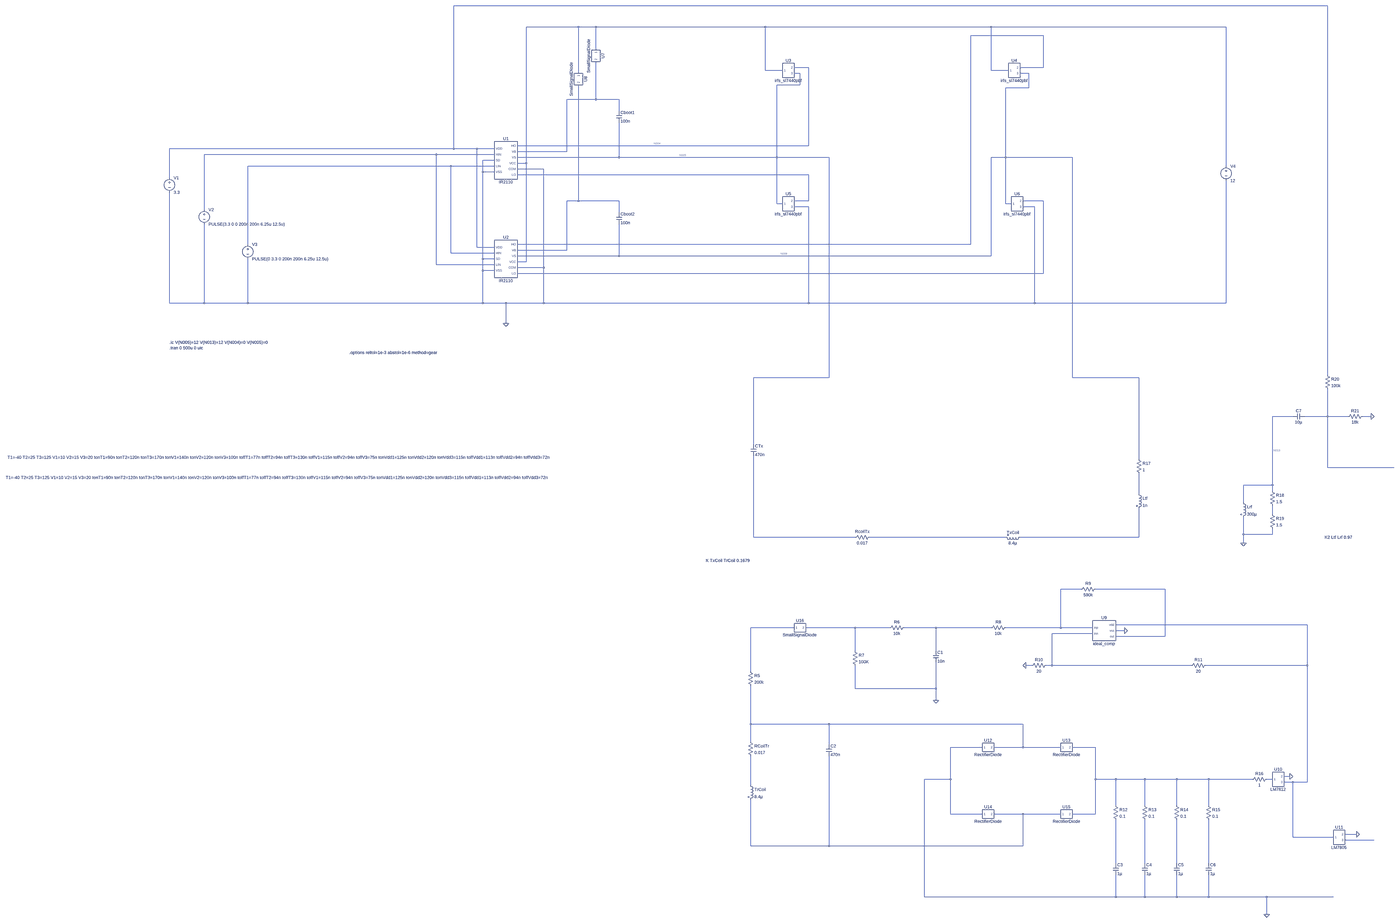
[diagram p0: schematic Integrated Circuit.asc, whole sheet]
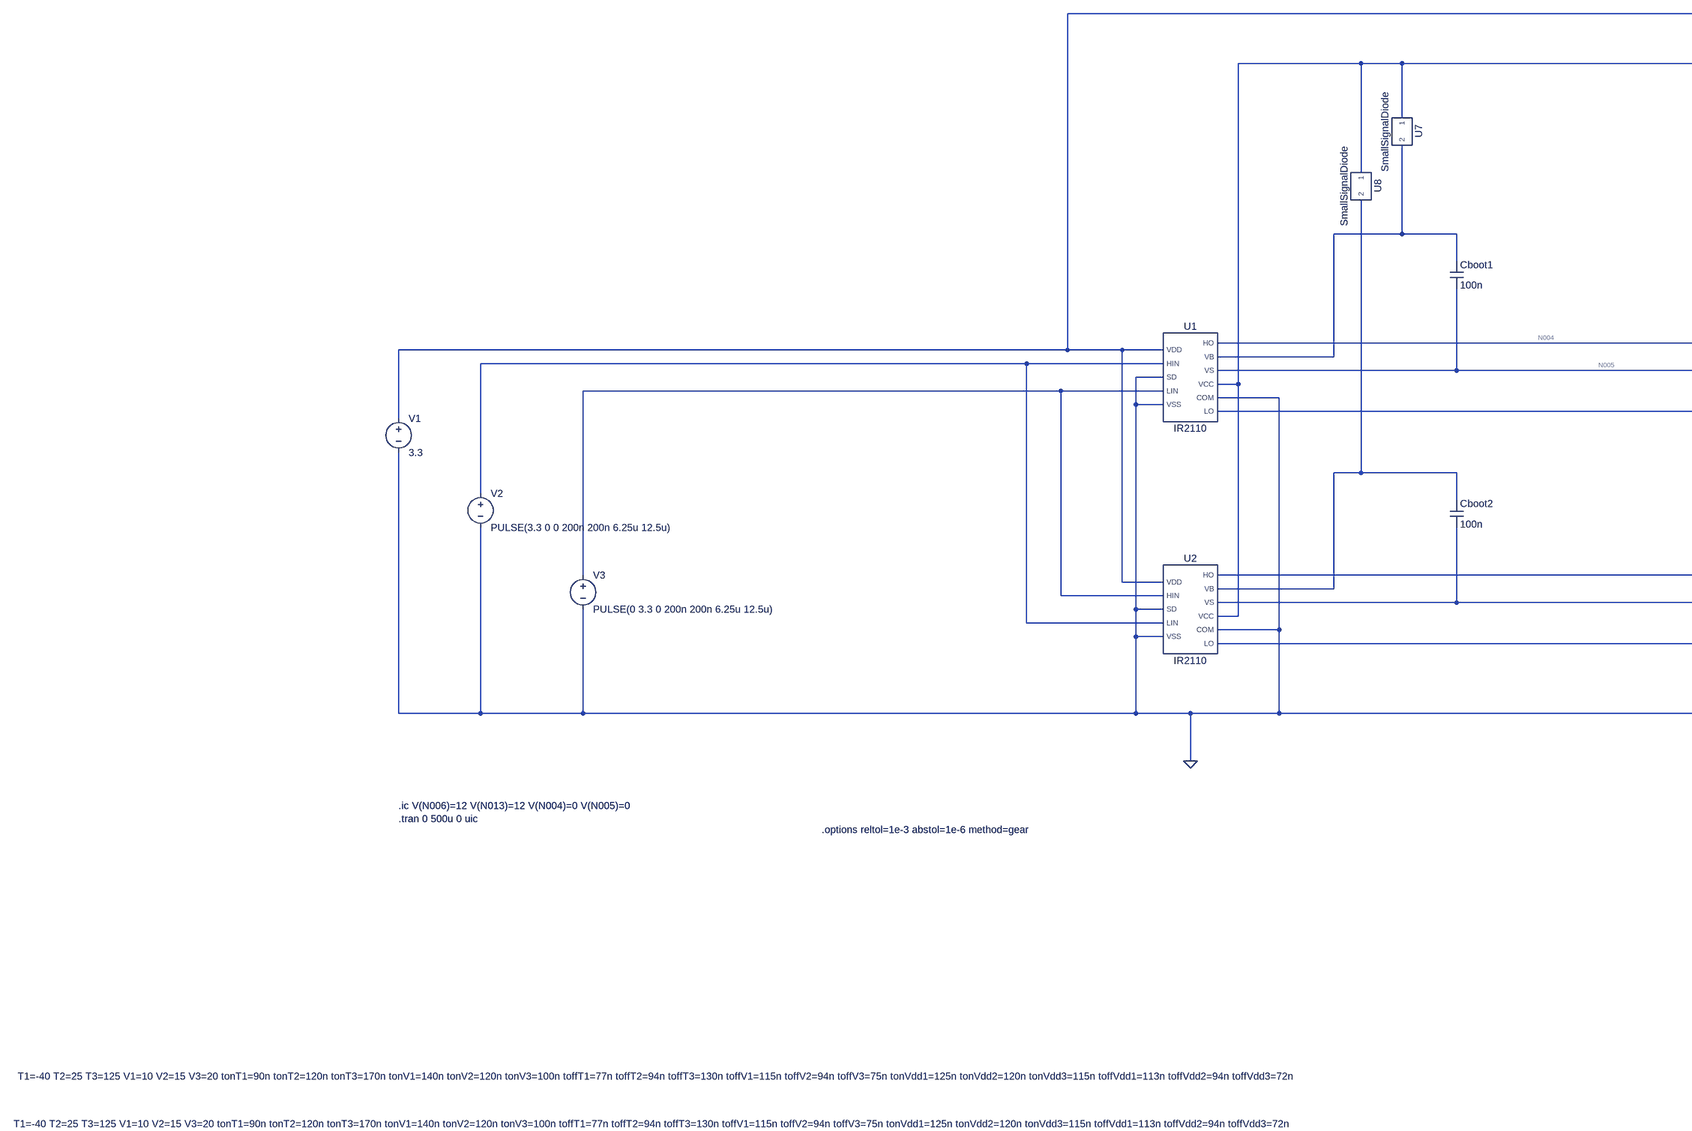
[diagram p1: schematic Integrated Circuit.asc, part, row 1 of 2, column 1 of 2]
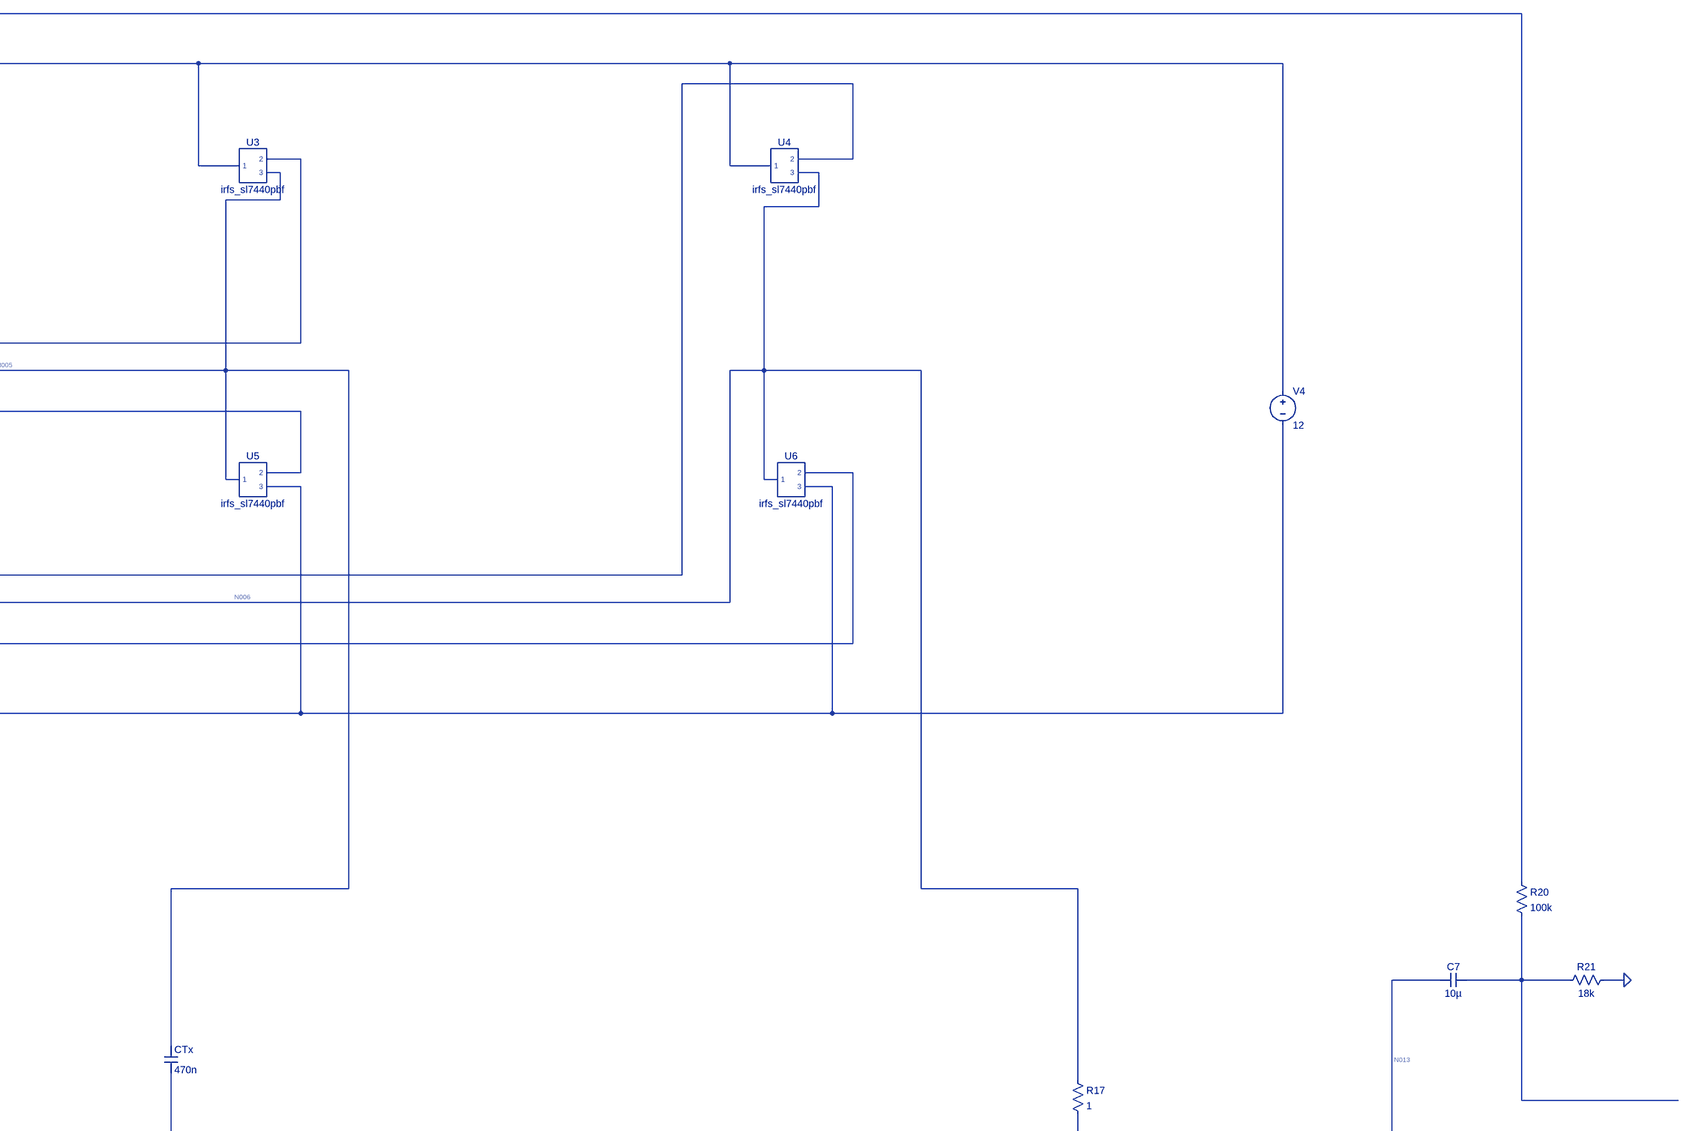
[diagram p2: schematic Integrated Circuit.asc, part, row 1 of 2, column 2 of 2]
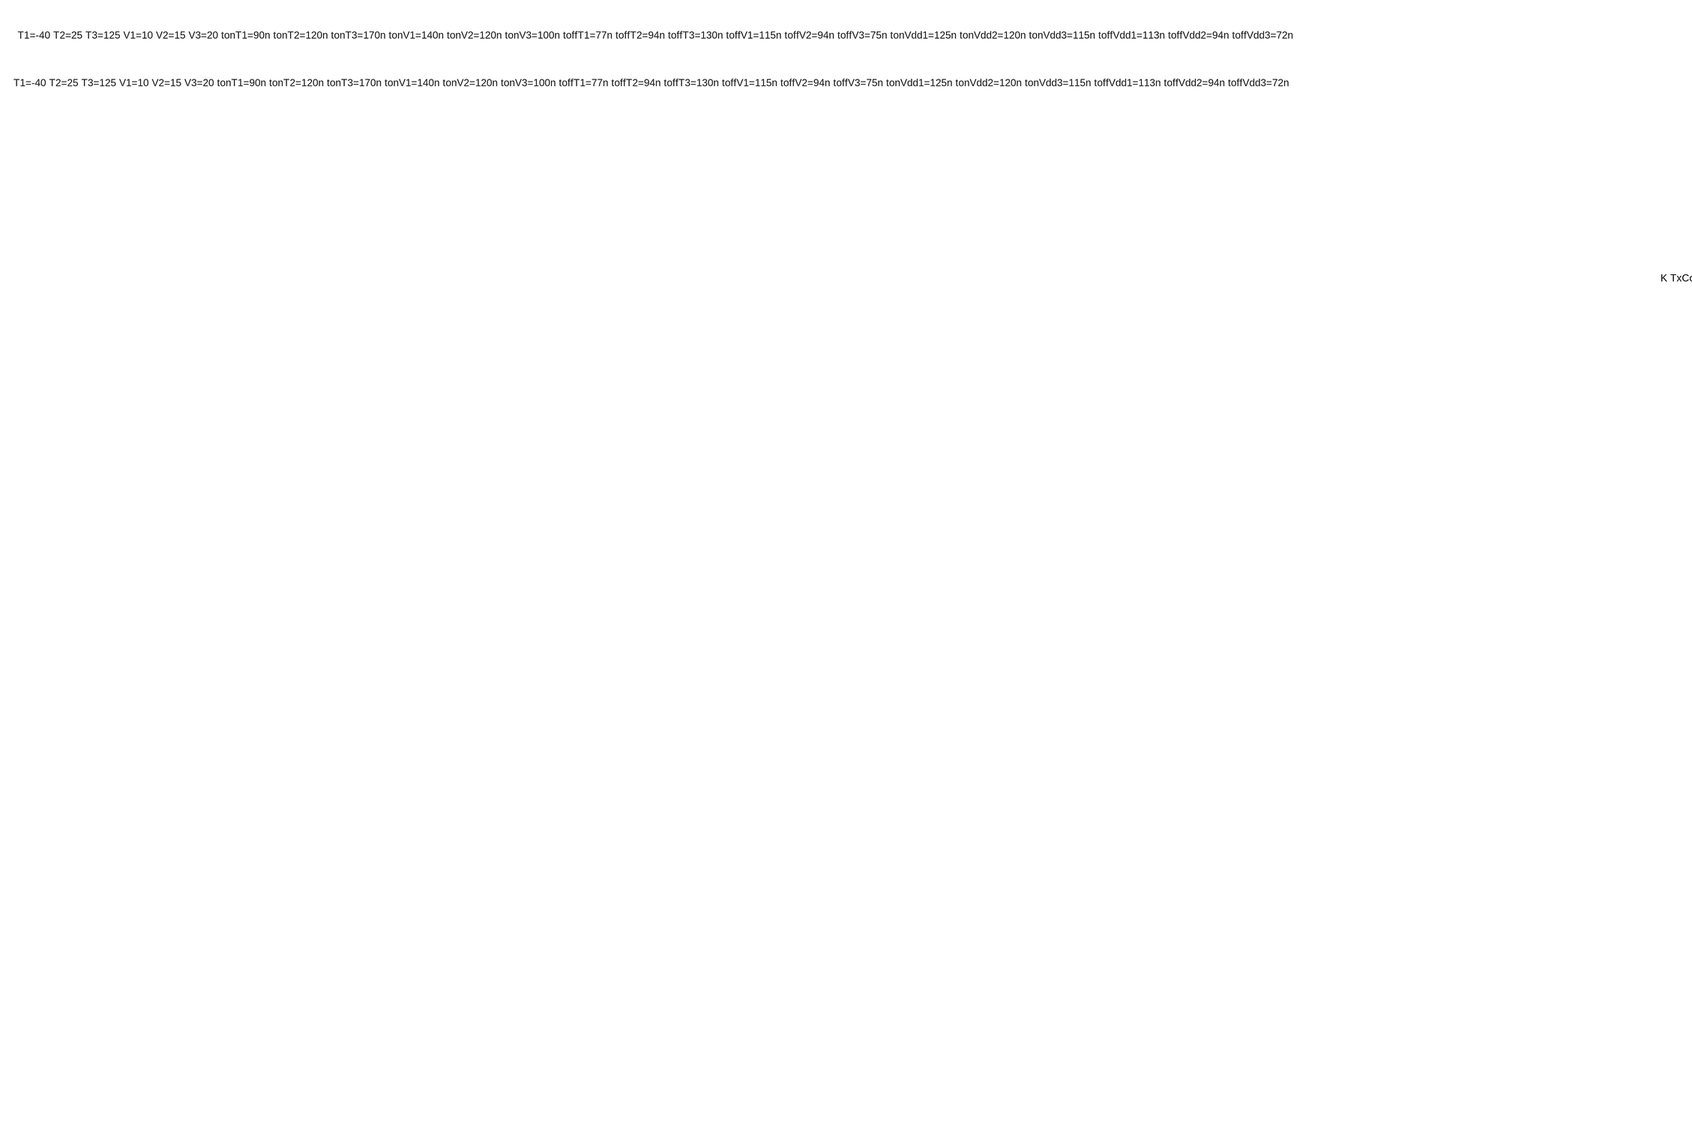
[diagram p3: schematic Integrated Circuit.asc, part, row 2 of 2, column 1 of 2]
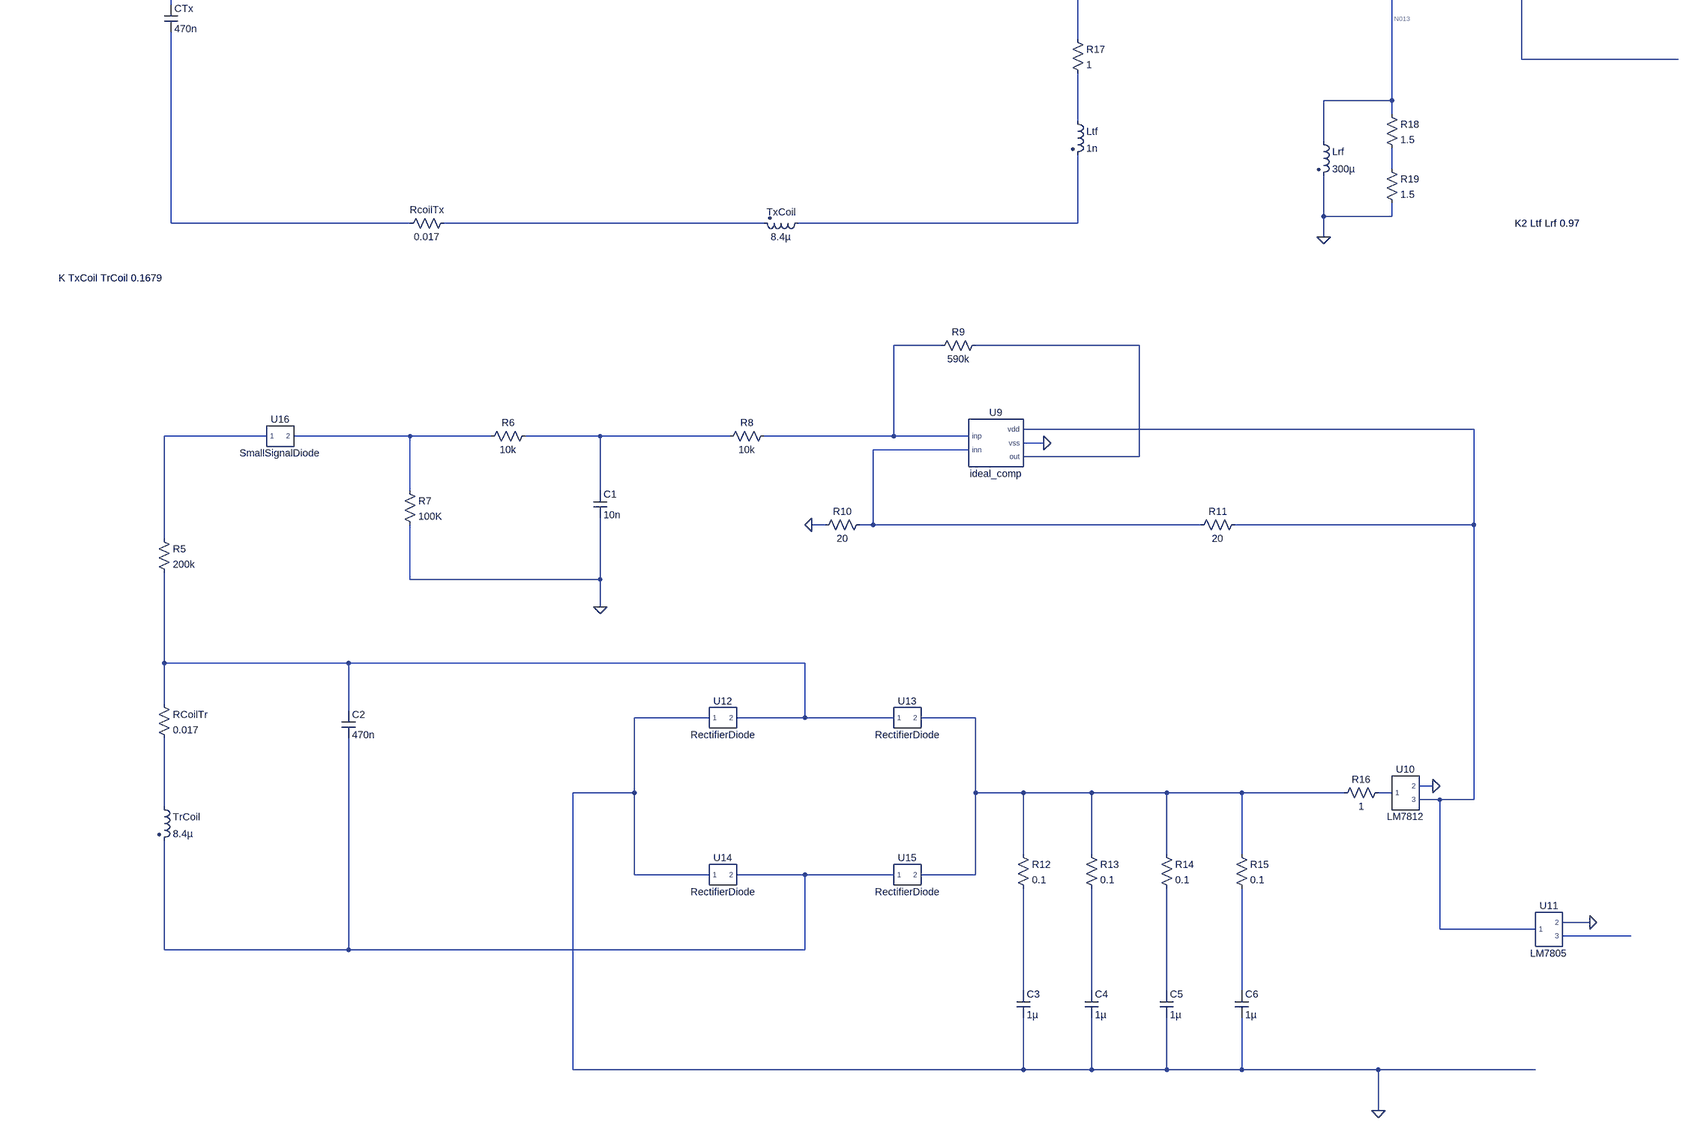
[diagram p4: schematic Integrated Circuit.asc, part, row 2 of 2, column 2 of 2]
Integrated Circuit.asc, the LTspice schematic file:
Version 4.1
SHEET 1 5604 5012
WIRE 5136 -896 -144 -896
WIRE 544 -688 256 -688
WIRE 640 -688 544 -688
WIRE 1920 -688 640 -688
WIRE 3280 -688 1920 -688
WIRE 4576 -688 3280 -688
WIRE 3568 -640 3168 -640
WIRE 640 -560 640 -688
WIRE 2160 -464 2080 -464
WIRE 3568 -464 3568 -640
WIRE 3568 -464 3440 -464
WIRE 1920 -448 1920 -688
WIRE 2016 -448 1920 -448
WIRE 3280 -448 3280 -688
WIRE 3376 -448 3280 -448
WIRE 544 -432 544 -688
WIRE 2112 -432 2080 -432
WIRE 3488 -432 3440 -432
WIRE 2112 -368 2112 -432
WIRE 2112 -368 1984 -368
WIRE 3488 -352 3488 -432
WIRE 3488 -352 3360 -352
WIRE 640 -288 640 -496
WIRE 640 -288 480 -288
WIRE 768 -288 640 -288
WIRE 768 -224 768 -288
WIRE 2160 -32 2160 -464
WIRE 2160 -32 208 -32
WIRE -144 -16 -144 -896
WIRE -144 -16 -1712 -16
WIRE -16 -16 -144 -16
WIRE 80 -16 -16 -16
WIRE 480 0 480 -288
WIRE 480 0 208 0
WIRE -240 16 -1520 16
WIRE 80 16 -240 16
WIRE 768 32 768 -160
WIRE 768 32 208 32
WIRE 1984 32 1984 -368
WIRE 1984 32 768 32
WIRE 2272 32 1984 32
WIRE 3360 32 3360 -352
WIRE 3360 32 3280 32
WIRE 3728 32 3360 32
WIRE 80 48 16 48
WIRE 256 64 256 -688
WIRE 256 64 208 64
WIRE -160 80 -1280 80
WIRE 80 80 -160 80
WIRE 4576 80 4576 -688
WIRE 352 96 208 96
WIRE 16 112 16 48
WIRE 80 112 16 112
WIRE 2160 128 208 128
WIRE -1712 144 -1712 -16
WIRE 544 272 544 -368
WIRE 544 272 480 272
WIRE 768 272 544 272
WIRE 2160 272 2160 128
WIRE 2160 272 2080 272
WIRE 3568 272 3456 272
WIRE 1984 288 1984 32
WIRE 2016 288 1984 288
WIRE 3360 288 3360 32
WIRE 3392 288 3360 288
WIRE 2160 304 2080 304
WIRE 3520 304 3456 304
WIRE -1520 320 -1520 16
WIRE 768 336 768 272
WIRE -1280 512 -1280 80
WIRE 3168 512 3168 -640
WIRE 3168 512 208 512
WIRE -16 528 -16 -16
WIRE 80 528 -16 528
WIRE 480 544 480 272
WIRE 480 544 208 544
WIRE -160 560 -160 80
WIRE 80 560 -160 560
WIRE 768 576 768 400
WIRE 768 576 208 576
WIRE 3280 576 3280 32
WIRE 3280 576 768 576
WIRE 16 592 16 112
WIRE 80 592 16 592
WIRE 256 608 256 64
WIRE 256 608 208 608
WIRE -240 624 -240 16
WIRE 80 624 -240 624
WIRE 352 640 352 96
WIRE 352 640 208 640
WIRE 16 656 16 592
WIRE 80 656 16 656
WIRE 3568 672 3568 272
WIRE 3568 672 208 672
WIRE -1712 1008 -1712 224
WIRE -1520 1008 -1520 400
WIRE -1520 1008 -1712 1008
WIRE -1280 1008 -1280 592
WIRE -1280 1008 -1520 1008
WIRE 16 1008 16 656
WIRE 16 1008 -1280 1008
WIRE 144 1008 16 1008
WIRE 352 1008 352 640
WIRE 352 1008 144 1008
WIRE 2160 1008 2160 304
WIRE 2160 1008 352 1008
WIRE 3520 1008 3520 304
WIRE 3520 1008 2160 1008
WIRE 4576 1008 4576 160
WIRE 4576 1008 3520 1008
WIRE 144 1120 144 1008
WIRE 5136 1616 5136 -896
WIRE 2272 1632 2272 32
WIRE 2272 1632 1856 1632
WIRE 3728 1632 3728 32
WIRE 4096 1632 3728 1632
WIRE 4944 1888 4832 1888
WIRE 5136 1888 5136 1696
WIRE 5136 1888 5008 1888
WIRE 5248 1888 5136 1888
WIRE 5376 1888 5328 1888
WIRE 1856 2048 1856 1632
WIRE 4096 2128 4096 1632
WIRE 5136 2176 5136 1888
WIRE 5600 2176 5136 2176
WIRE 4832 2272 4832 1888
WIRE 4832 2272 4672 2272
WIRE 4832 2304 4832 2272
WIRE 4096 2320 4096 2208
WIRE 4672 2368 4672 2272
WIRE 4832 2432 4832 2384
WIRE 4672 2544 4672 2448
WIRE 4832 2544 4832 2512
WIRE 4832 2544 4672 2544
WIRE 1856 2560 1856 2112
WIRE 2416 2560 1856 2560
WIRE 3360 2560 2496 2560
WIRE 4096 2560 4096 2400
WIRE 4096 2560 3440 2560
WIRE 4672 2592 4672 2544
WIRE 3776 2864 3664 2864
WIRE 4240 2864 3856 2864
WIRE 5024 3152 3968 3152
WIRE 2080 3168 1840 3168
WIRE 2416 3168 2144 3168
WIRE 2624 3168 2416 3168
WIRE 2976 3168 2704 3168
WIRE 3280 3168 2976 3168
WIRE 3664 3168 3664 2864
WIRE 3664 3168 3360 3168
WIRE 3840 3168 3664 3168
WIRE 4016 3184 3968 3184
WIRE 3840 3200 3616 3200
WIRE 4240 3216 4240 2864
WIRE 4240 3216 3968 3216
WIRE 2416 3296 2416 3168
WIRE 2976 3296 2976 3168
WIRE 3504 3376 3472 3376
WIRE 3616 3376 3616 3200
WIRE 3616 3376 3584 3376
WIRE 4384 3376 3616 3376
WIRE 5024 3376 5024 3152
WIRE 5024 3376 4464 3376
WIRE 1840 3408 1840 3168
WIRE 2416 3504 2416 3376
WIRE 2976 3504 2976 3360
WIRE 2976 3504 2416 3504
WIRE 2976 3568 2976 3504
WIRE 1840 3904 1840 3488
WIRE 2272 3904 1840 3904
WIRE 3456 3904 2272 3904
WIRE 1840 4000 1840 3904
WIRE 2272 4016 2272 3904
WIRE 3232 4032 3056 4032
WIRE 3456 4032 3456 3904
WIRE 3456 4032 3296 4032
WIRE 3664 4032 3456 4032
WIRE 3856 4032 3728 4032
WIRE 4928 4192 4896 4192
WIRE 3056 4208 3056 4032
WIRE 3056 4208 2912 4208
WIRE 3856 4208 3856 4032
WIRE 3968 4208 3856 4208
WIRE 4128 4208 3968 4208
WIRE 4304 4208 4128 4208
WIRE 4480 4208 4304 4208
WIRE 4720 4208 4480 4208
WIRE 4832 4208 4800 4208
WIRE 4944 4224 4896 4224
WIRE 5024 4224 5024 3376
WIRE 5024 4224 4944 4224
WIRE 1840 4240 1840 4080
WIRE 3968 4352 3968 4208
WIRE 4128 4352 4128 4208
WIRE 4304 4352 4304 4208
WIRE 4480 4352 4480 4208
WIRE 3056 4400 3056 4208
WIRE 3232 4400 3056 4400
WIRE 3456 4400 3296 4400
WIRE 3664 4400 3456 4400
WIRE 3856 4400 3856 4208
WIRE 3856 4400 3728 4400
WIRE 5296 4512 5232 4512
WIRE 4944 4528 4944 4224
WIRE 5168 4528 4944 4528
WIRE 5392 4544 5232 4544
WIRE 1840 4576 1840 4320
WIRE 2272 4576 2272 4080
WIRE 2272 4576 1840 4576
WIRE 3456 4576 3456 4400
WIRE 3456 4576 2272 4576
WIRE 3968 4672 3968 4432
WIRE 4128 4672 4128 4432
WIRE 4304 4672 4304 4432
WIRE 4480 4672 4480 4432
WIRE 2912 4896 2912 4208
WIRE 3968 4896 3968 4736
WIRE 3968 4896 2912 4896
WIRE 4128 4896 4128 4736
WIRE 4128 4896 3968 4896
WIRE 4304 4896 4304 4736
WIRE 4304 4896 4128 4896
WIRE 4480 4896 4480 4736
WIRE 4480 4896 4304 4896
WIRE 4800 4896 4480 4896
WIRE 5168 4896 4800 4896
WIRE 4800 4992 4800 4896
FLAG 144 1120 0
FLAG 2976 3568 0
FLAG 3472 3376 0
FLAG 4016 3184 0
FLAG 4800 4992 0
FLAG 4928 4192 0
FLAG 5296 4512 0
FLAG 4672 2592 0
FLAG 5376 1888 0
SYMBOL IR2110 144 48 R0
WINDOW 39 -1247 2167 Top 2
SYMATTR InstName U1
SYMBOL IR2110 144 592 R0
WINDOW 39 -1237 1511 Top 2
SYMATTR InstName U2
SYMBOL voltage -1712 128 R0
SYMATTR InstName V1
SYMATTR Value 3.3
SYMBOL voltage -1520 304 R0
WINDOW 123 0 0 Left 0
WINDOW 39 0 0 Left 0
SYMATTR InstName V2
SYMATTR Value PULSE(3.3 0 0 200n 200n 6.25u 12.5u)
SYMBOL voltage -1280 496 R0
WINDOW 123 0 0 Left 0
WINDOW 39 0 0 Left 0
SYMATTR InstName V3
SYMATTR Value PULSE(0 3.3 0 200n 200n 6.25u 12.5u)
SYMBOL irfs_sl7440pbf 2048 -448 R0
SYMATTR InstName U3
SYMBOL irfs_sl7440pbf 3408 -448 R0
SYMATTR InstName U4
SYMBOL irfs_sl7440pbf 2048 288 R0
SYMATTR InstName U5
SYMBOL irfs_sl7440pbf 3424 288 R0
SYMATTR InstName U6
SYMBOL voltage 4576 64 R0
SYMATTR InstName V4
SYMATTR Value 12
SYMBOL cap 752 -224 R0
SYMATTR InstName Cboot1
SYMATTR Value 100n
SYMBOL cap 752 336 R0
SYMATTR InstName Cboot2
SYMATTR Value 100n
SYMBOL SmallSignalDiode 640 -528 R90
SYMATTR InstName U7
SYMBOL SmallSignalDiode 544 -400 R90
SYMATTR InstName U8
SYMBOL cap 1840 2048 R0
SYMATTR InstName CTx
SYMATTR Value 470n
SYMBOL res 2512 2544 R90
WINDOW 0 0 56 VBottom 2
WINDOW 3 32 56 VTop 2
SYMATTR InstName RcoilTx
SYMATTR Value 0.017
SYMBOL ind2 3456 2544 R90
WINDOW 0 5 56 VBottom 2
WINDOW 3 32 56 VTop 2
SYMATTR InstName TxCoil
SYMATTR Value 8.4µ
SYMATTR Type ind
SYMBOL ind2 1824 4224 R0
SYMATTR InstName TrCoil
SYMATTR Value 8.4µ
SYMATTR Type ind
SYMBOL res 1824 3392 R0
SYMATTR InstName R5
SYMATTR Value 200k
SYMBOL res 2720 3152 R90
WINDOW 0 0 56 VBottom 2
WINDOW 3 32 56 VTop 2
SYMATTR InstName R6
SYMATTR Value 10k
SYMBOL res 2400 3280 R0
SYMATTR InstName R7
SYMATTR Value 100K
SYMBOL cap 2960 3296 R0
SYMATTR InstName C1
SYMATTR Value 10n
SYMBOL res 3376 3152 R90
WINDOW 0 0 56 VBottom 2
WINDOW 3 32 56 VTop 2
SYMATTR InstName R8
SYMATTR Value 10k
SYMBOL res 3872 2848 R90
WINDOW 0 0 56 VBottom 2
WINDOW 3 32 56 VTop 2
SYMATTR InstName R9
SYMATTR Value 590k
SYMBOL ideal_comp 3904 3184 R0
SYMATTR InstName U9
SYMBOL res 3600 3360 R90
WINDOW 0 0 56 VBottom 2
WINDOW 3 32 56 VTop 2
SYMATTR InstName R10
SYMATTR Value 20
SYMBOL res 4480 3360 R90
WINDOW 0 0 56 VBottom 2
WINDOW 3 32 56 VTop 2
SYMATTR InstName R11
SYMATTR Value 20
SYMBOL cap 2256 4016 R0
SYMATTR InstName C2
SYMATTR Value 470n
SYMBOL res 3952 4336 R0
SYMATTR InstName R12
SYMATTR Value 0.1
SYMBOL res 4112 4336 R0
SYMATTR InstName R13
SYMATTR Value 0.1
SYMBOL res 4288 4336 R0
SYMATTR InstName R14
SYMATTR Value 0.1
SYMBOL res 4464 4336 R0
SYMATTR InstName R15
SYMATTR Value 0.1
SYMBOL cap 3952 4672 R0
SYMATTR InstName C3
SYMATTR Value 1µ
SYMBOL cap 4112 4672 R0
SYMATTR InstName C4
SYMATTR Value 1µ
SYMBOL cap 4288 4672 R0
SYMATTR InstName C5
SYMATTR Value 1µ
SYMBOL cap 4464 4672 R0
SYMATTR InstName C6
SYMATTR Value 1µ
SYMBOL res 4816 4192 R90
WINDOW 0 0 56 VBottom 2
WINDOW 3 32 56 VTop 2
SYMATTR InstName R16
SYMATTR Value 1
SYMBOL LM7812 4864 4208 R0
SYMATTR InstName U10
SYMBOL LM7805 5200 4528 R0
SYMATTR InstName U11
SYMBOL RectifierDiode 3264 4032 R0
SYMATTR InstName U12
SYMBOL RectifierDiode 3696 4032 R0
SYMATTR InstName U13
SYMBOL RectifierDiode 3264 4400 R0
SYMATTR InstName U14
SYMBOL RectifierDiode 3696 4400 R0
SYMATTR InstName U15
SYMBOL SmallSignalDiode 2112 3168 R0
SYMATTR InstName U16
SYMBOL res 1824 3984 R0
SYMATTR InstName RCoilTr
SYMATTR Value 0.017
SYMBOL res 4080 2112 R0
SYMATTR InstName R17
SYMATTR Value 1
SYMBOL ind2 4080 2304 R0
SYMATTR InstName Ltf
SYMATTR Value 1n
SYMATTR Type ind
SYMBOL ind2 4656 2352 R0
SYMATTR InstName Lrf
SYMATTR Value 300µ
SYMATTR Type ind
SYMBOL Res 4816 2288 R0
SYMATTR InstName R18
SYMATTR Value 1.5
SYMBOL Res 4816 2416 R0
SYMATTR InstName R19
SYMATTR Value 1.5
SYMBOL Res 5120 1600 R0
SYMATTR InstName R20
SYMATTR Value 100k
SYMBOL Res 5344 1872 R90
WINDOW 0 0 56 VBottom 2
WINDOW 3 32 56 VTop 2
SYMATTR InstName R21
SYMATTR Value 18k
SYMBOL Cap 5008 1872 R90
WINDOW 0 0 32 VBottom 2
WINDOW 3 32 32 VTop 2
SYMATTR InstName C7
SYMATTR Value 10µ
TEXT -720 1280 Left 2 !.options reltol=1e-3 abstol=1e-6 method=gear
TEXT -1712 1224 Left 2 !.ic V(N006)=12 V(N013)=12 V(N004)=0 V(N005)=0\n.tran 0 500u 0 uic
TEXT 1592 2688 Left 2 !K TxCoil TrCoil 0.1679
TEXT 5120 2560 Left 2 !K2 Ltf Lrf 0.97

The netlist it stands for:
* Integrated Circuit.asc
X§U1 N001 N008 0 N009 0 N004 N007 N005 N002 0 N010 IR2110 T1=-40 T2=25 T3=125 V1=10 V2=15 V3=20 tonT1=90n tonT2=120n tonT3=170n tonV1=140n tonV2=120n tonV3=100n toffT1=77n toffT2=94n toffT3=130n toffV1=115n toffV2=94n toffV3=75n tonVdd1=125n tonVdd2=120n tonVdd3=115n toffVdd1=113n toffVdd2=94n toffVdd3=72n  ; pins VDD HIN SD LIN VSS HO VB VS VCC COM LO
X§U2 N001 N009 0 N008 0 N003 N011 N006 N002 0 N012 IR2110 T1=-40 T2=25 T3=125 V1=10 V2=15 V3=20 tonT1=90n tonT2=120n tonT3=170n tonV1=140n tonV2=120n tonV3=100n toffT1=77n toffT2=94n toffT3=130n toffV1=115n toffV2=94n toffV3=75n tonVdd1=125n tonVdd2=120n tonVdd3=115n toffVdd1=113n toffVdd2=94n toffVdd3=72n  ; pins VDD HIN SD LIN VSS HO VB VS VCC COM LO
V1 N001 0 3.3
V2 N008 0 PULSE(3.3 0 0 200n 200n 6.25u 12.5u)
V3 N009 0 PULSE(0 3.3 0 200n 200n 6.25u 12.5u)
X§U3 N002 N004 N005 irfs_sl7440pbf  ; pins 1 2 3
X§U4 N002 N003 N006 irfs_sl7440pbf  ; pins 1 2 3
X§U5 N005 N010 0 irfs_sl7440pbf  ; pins 1 2 3
X§U6 N006 N012 0 irfs_sl7440pbf  ; pins 1 2 3
V4 N002 0 12
Cboot1 N007 N005 100n
Cboot2 N011 N006 100n
X§U7 N002 N007 SmallSignalDiode  ; pins 1 2
X§U8 N002 N011 SmallSignalDiode  ; pins 1 2
CTx N005 N017 470n
RcoilTx N018 N017 0.017
L§TxCoil N019 N018 8.4µ
L§TrCoil N030 N031 8.4µ
R5 N023 N027 200k
R6 N025 N024 10k
R7 N024 0 100K
C1 N025 0 10n
R8 N020 N025 10k
R9 N021 N020 590k
X§U9 N020 N026 N022 0 N021 ideal_comp  ; pins inp inn vdd vss out
R10 N026 0 20
R11 N022 N026 20
C2 N027 N031 470n
R12 N028 N033 0.1
R13 N028 N034 0.1
R14 N028 N035 0.1
R15 N028 N036 0.1
C3 N033 0 1µ
C4 N034 0 1µ
C5 N035 0 1µ
C6 N036 0 1µ
R16 N029 N028 1
X§U10 N029 0 N022 LM7812  ; pins 1 2 3
X§U11 N022 0 N032 LM7805  ; pins 1 2 3
X§U12 0 N027 RectifierDiode  ; pins 1 2
X§U13 N027 N028 RectifierDiode  ; pins 1 2
X§U14 0 N031 RectifierDiode  ; pins 1 2
X§U15 N031 N028 RectifierDiode  ; pins 1 2
X§U16 N023 N024 SmallSignalDiode  ; pins 1 2
RCoilTr N027 N030 0.017
R17 N006 N015 1
Ltf N015 N019 1n
Lrf N013 0 300µ
R18 N013 N016 1.5
R19 N016 0 1.5
R20 N001 N014 100k
R21 0 N014 18k
C7 N014 N013 10µ
.options reltol=1e-3 abstol=1e-6 method=gear
.ic V(N006)=12 V(N013)=12 V(N004)=0 V(N005)=0
.tran 0 500u 0 uic
K TxCoil TrCoil 0.1679
K2 Ltf Lrf 0.97
.lib IR2110.spi
.lib irfs_sl7440pbf.spi
.lib SmallSignalDiode.spi
.lib Ideal_comp.spi
.lib LM7812.spi
.lib LM7805.spi
.lib RectifierDiode.spi
.backanno
.end